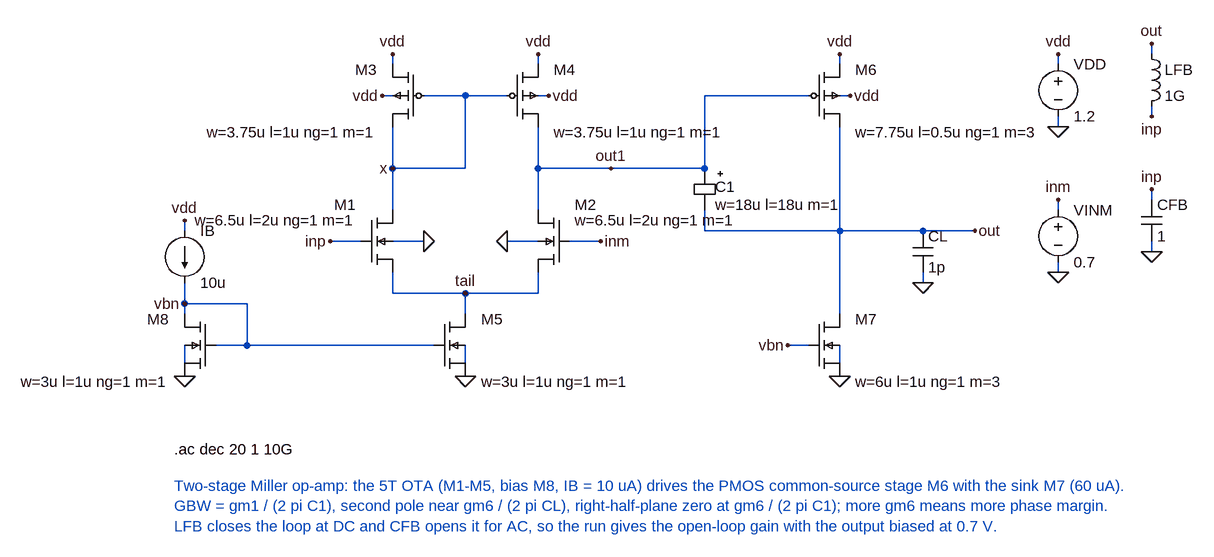
[diagram p0: schematic two_stage.asc]
two_stage.asc, the LTspice schematic file:
Version 4
SHEET 1 1400 900
WIRE 240 96 240 80
WIRE 240 144 224 144
WIRE 464 96 464 80
WIRE 464 144 480 144
WIRE 288 144 416 144
WIRE 192 368 144 368
WIRE 240 368 288 368
WIRE 512 368 560 368
WIRE 464 368 416 368
WIRE 240 192 240 320
WIRE 240 256 352 256
WIRE 352 256 352 144
WIRE 464 192 464 320
WIRE 240 416 240 448
WIRE 240 448 464 448
WIRE 464 448 464 416
WIRE 352 480 352 448
WIRE -80 352 -80 336
WIRE -80 432 -80 480
WIRE -80 464 16 464
WIRE 16 464 16 528
WIRE 928 96 928 80
WIRE 928 144 944 144
WIRE 464 256 720 256
WIRE 720 256 720 144
WIRE 720 144 880 144
WIRE 880 528 848 528
WIRE -32 528 304 528
WIRE 928 192 928 480
WIRE 720 320 720 352
WIRE 720 352 928 352
WIRE 352 528 352 576
WIRE -80 528 -80 576
WIRE 928 528 928 576
WIRE 928 352 1136 352
WIRE 1056 416 1056 432
WIRE 1264 96 1264 80
WIRE 1264 176 1264 192
WIRE 1264 320 1264 304
WIRE 1264 400 1264 416
WIRE 1408 80 1408 64
WIRE 1408 160 1408 176
WIRE 1408 304 1408 288
WIRE 1408 368 1408 384
FLAG 240 80 vdd
FLAG 224 144 vdd
FLAG 464 80 vdd
FLAG 480 144 vdd
FLAG 144 368 inp
FLAG 288 368 0
FLAG 560 368 inm
FLAG 416 368 0
FLAG 240 256 x
FLAG 352 448 tail
FLAG -80 336 vdd
FLAG -80 464 vbn
FLAG 928 80 vdd
FLAG 944 144 vdd
FLAG 576 256 out1
FLAG 848 528 vbn
FLAG 352 576 0
FLAG -80 576 0
FLAG 928 576 0
FLAG 1136 352 out
FLAG 1056 432 0
FLAG 1264 80 vdd
FLAG 1264 192 0
FLAG 1264 304 inm
FLAG 1264 416 0
FLAG 1408 64 out
FLAG 1408 176 inp
FLAG 1408 288 inp
FLAG 1408 384 0
SYMBOL sg13g2\sg13_lv_pmos 288 96 M0
WINDOW 0 72 8 Left 2
WINDOW 3 0 0 Invisible 2
WINDOW 39 72 104 Left 2
SYMATTR InstName M3
SYMATTR SpiceLine w=3.75u l=1u ng=1 m=1
SYMBOL sg13g2\sg13_lv_pmos 416 96 R0
WINDOW 0 72 8 Left 2
WINDOW 3 0 0 Invisible 2
WINDOW 39 72 104 Left 2
SYMATTR InstName M4
SYMATTR SpiceLine w=3.75u l=1u ng=1 m=1
SYMBOL sg13g2\sg13_lv_nmos 192 320 R0
WINDOW 0 -8 -8 Right 2
WINDOW 3 0 0 Invisible 2
WINDOW 39 -8 16 Right 2
SYMATTR InstName M1
SYMATTR SpiceLine w=6.5u l=2u ng=1 m=1
SYMBOL sg13g2\sg13_lv_nmos 512 320 M0
WINDOW 0 -8 -8 Right 2
WINDOW 3 0 0 Invisible 2
WINDOW 39 -8 16 Right 2
SYMATTR InstName M2
SYMATTR SpiceLine w=6.5u l=2u ng=1 m=1
SYMBOL sg13g2\sg13_lv_nmos 304 480 R0
WINDOW 0 72 8 Left 2
WINDOW 3 0 0 Invisible 2
WINDOW 39 72 104 Left 2
SYMATTR InstName M5
SYMATTR SpiceLine w=3u l=1u ng=1 m=1
SYMBOL sg13g2\sg13_lv_nmos -32 480 M0
WINDOW 0 72 8 Left 2
WINDOW 3 0 0 Invisible 2
WINDOW 39 72 104 Left 2
SYMATTR InstName M8
SYMATTR SpiceLine w=3u l=1u ng=1 m=1
SYMBOL current -80 352 R0
SYMATTR InstName IB
SYMATTR Value 10u
SYMBOL sg13g2\sg13_lv_pmos 880 96 R0
WINDOW 0 72 8 Left 2
WINDOW 3 0 0 Invisible 2
WINDOW 39 72 104 Left 2
SYMATTR InstName M6
SYMATTR SpiceLine w=7.75u l=0.5u ng=1 m=3
SYMBOL sg13g2\sg13_lv_nmos 880 480 R0
WINDOW 0 72 8 Left 2
WINDOW 3 0 0 Invisible 2
WINDOW 39 72 104 Left 2
SYMATTR InstName M7
SYMATTR SpiceLine w=6u l=1u ng=1 m=3
SYMBOL sg13g2\cap_cmim 704 256 R0
WINDOW 0 32 28 Left 2
WINDOW 3 0 0 Invisible 2
WINDOW 39 32 56 Left 2
SYMATTR InstName C1
SYMATTR SpiceLine w=18u l=18u m=1
SYMBOL cap 1040 352 R0
SYMATTR InstName CL
SYMATTR Value 1p
SYMBOL voltage 1264 80 R0
SYMATTR InstName VDD
SYMATTR Value 1.2
SYMBOL voltage 1264 304 R0
SYMATTR InstName VINM
SYMATTR Value 0.7
SYMATTR Value2 AC 1
SYMBOL ind 1392 64 R0
SYMATTR InstName LFB
SYMATTR Value 1G
SYMBOL cap 1392 304 R0
SYMATTR InstName CFB
SYMATTR Value 1
TEXT -96 688 Left 2 !.ac dec 20 1 10G
TEXT -96 744 Left 2 ;Two-stage Miller op-amp: the 5T OTA (M1-M5, bias M8, IB = 10 uA) drives the PMOS common-source stage M6 with the sink M7 (60 uA).\nGBW = gm1 / (2 pi C1), second pole near gm6 / (2 pi CL), right-half-plane zero at gm6 / (2 pi C1); more gm6 means more phase margin.\nLFB closes the loop at DC and CFB opens it for AC, so the run gives the open-loop gain with the output biased at 0.7 V.

The netlist it stands for:
* two_stage.asc
XM3 x x vdd vdd sg13_lv_pmos w=3.75u l=1u ng=1 m=1  ; pins D G S B
XM4 out1 x vdd vdd sg13_lv_pmos w=3.75u l=1u ng=1 m=1  ; pins D G S B
XM1 x inp tail 0 sg13_lv_nmos w=6.5u l=2u ng=1 m=1  ; pins D G S B
XM2 out1 inm tail 0 sg13_lv_nmos w=6.5u l=2u ng=1 m=1  ; pins D G S B
XM5 tail vbn 0 0 sg13_lv_nmos w=3u l=1u ng=1 m=1  ; pins D G S B
XM8 vbn vbn 0 0 sg13_lv_nmos w=3u l=1u ng=1 m=1  ; pins D G S B
IB vdd vbn 10u
XM6 out out1 vdd vdd sg13_lv_pmos w=7.75u l=0.5u ng=1 m=3  ; pins D G S B
XM7 out vbn 0 0 sg13_lv_nmos w=6u l=1u ng=1 m=3  ; pins D G S B
XC1 out1 out cap_cmim w=18u l=18u m=1  ; pins PLUS MINUS
CL out 0 1p
VDD vdd 0 1.2
VINM inm 0 0.7 AC 1
LFB out inp 1G
CFB inp 0 1
.ac dec 20 1 10G
* Two-stage Miller op-amp: the 5T OTA (M1-M5, bias M8, IB = 10 uA) drives the PMOS common-source stage M6 with the sink M7 (60 uA).
* GBW = gm1 / (2 pi C1), second pole near gm6 / (2 pi CL), right-half-plane zero at gm6 / (2 pi C1); more gm6 means more phase margin.
* LFB closes the loop at DC and CFB opens it for AC, so the run gives the open-loop gain with the output biased at 0.7 V.
.backanno
.end